# Altium schematic sheet PWM.SchDoc
size A4; SheetNumber: 1; SheetTotal: 4
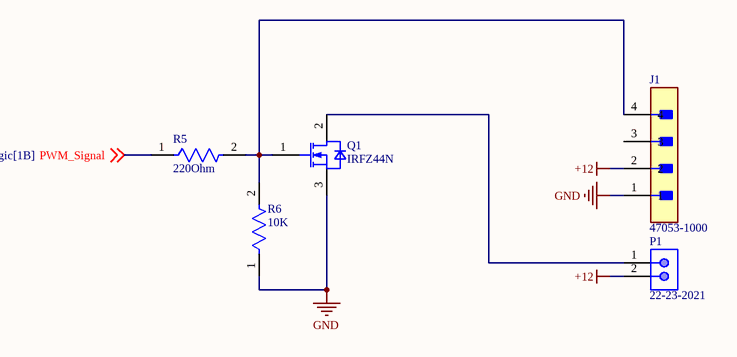
[diagram p0: PWM.SchDoc]

## Parts
J1  47053-1000  [FP-470531000-MFG]
P1  22-23-2021  [MOLX-22-23-2021_V]
Q1  IRFZ44N  [TO220]
R5  220Ohm  [FP-CRGCQ1206-IPC_C]
R6  10K  [FP-CRGCQ1206-IPC_C]

## Nets
+12: J1.2 P1.2
GND: J1.1 Q1.3(SOURCE) R6.1
PWM_Signal: R5.1 ; off-sheet PWM_Signal
NetJ1_4: J1.4 Q1.1(GATE) R5.2 R6.2
NetP1_1: P1.1 Q1.2(DRAIN)

Not connected (* = marked no-connect by the designer): J1 3

## Library data of the parts
J1 = CMP-04776-000290-2: CONN HEADER VERT 4POS 2.54MM; NexarPartId: 854935; Manufacturer Lifecycle Status: ACTIVE; Voltage Rating (DC): 250V; Gender: Male; Plating: Copper; Number of Positions: 4; Glow Wire Compliant: Non-compliant; Current Rating: 500mA; Max Operating Temperature: 75°C; Number of Rows: 1; REACH SVHC: Unknown; Ambient Temperature Range High: 105°C; Pitch: 2.54mm; Height: 7.7mm; Min Operating Temperature: 0°C; Packaging: Bulk; Contact Material: Brass, Copper; Contact Plating: Tin; Lead Pitch: 2.54mm; Voltage Rating: 250V; Termination: Through Hole; Radiation Hardening: No; Orientation: Vertical; Mount: Through Hole; Number of Pins: 4; Country of Origin: HK; Halogen Free: Low Halogen; Lifecycle Status: Production; Number of Circuits: 4; Schedule B: 8536694040, 8536694040; Housing Color: Beige; Housing Material: Nylon; Depth: 5.84mm; RoHS: Compliant; Length: 10.2mm; Number of Contacts: 4
P1 = CMP-1704-00001-3: Male Header, Pitch 2.54 mm, 1 x 2 Position, Height 10.67 mm, Tail Length 3.56 mm, 0 to 75 degC, RoHS, Bulk; Package Quantity: 3000; Height: 10.67 mm; RoHSCompliant: True; ComponentLink2URL: https://datasheet.ciiva.com/19454/232266-19454304.pdf; PartNumber: 22-23-2021; Packaging: Bulk; ComponentLink2Description: Datasheet; Min Operating Temperature: 0 degC; ComponentLink1Description: Manufacturer URL; Length: 5.08 mm; Mounting Technology: Through Hole; Max Operating Temperature: 75 degC; REACH SVHC: Unknown; PackageDescription: Male Header, Pitch 2.54 mm, 1 x 2 Position, Height 10.67 mm, Tail Length 3.56 mm; ComponentLink1URL: http://www.molex.com/; Mount: Through Hole; Radiation Hardening: No; Width: 6.35 mm; Pins: 2
Q1 = IRFZ44N: OptiMOS 3 Power-Transistor, VDS 100V; Manufacturer: Infineon Technologies; Manufacturer Order Number: IRFZ44N; PackageReference: PG-TO220-3-904
R5 R6 = CMP-03211-000249-1: CRGCQ1206 100KΩ 0.25W 1% ±100ppm/°C 200V; Manufacturer: TE Connectivity; Manufacturer Part Number: CRGCQ1206F100K; Tolerance: 0.01; Automotive Grade: Grade 1141; Lead Free: Yes; Power Rating: 0.25W; Resistance: 100KΩ; ComponentLink2Description: Datasheet; Voltage Rating: 200V; Ambient Temperature Range High: +70°C; Device Class L1: Passive Components; Value: 100KΩ; ComponentLink2URL: https://www.te.com/commerce/DocumentDelivery/DDEController?Action=showdoc&DocId=Data+Sheet%7F1773204-3%7F1%7Fpdf%7FEnglish%7FENG_DS_1773204-3_1.pdf%7F4-2176347-1150; Temperature Range High: +155°C; Category: Res; RoHS: TRUE; Temperature: -55°C to +155°C; Series: CRGCQ; Package: CRGCQ1206; Device Class L3: Chip SMD Resistors; Height: 0.65mm; Automotive: Yes; Temperature Coefficient: ±100ppm/°C; Temperature Range Low: -55°C; Ipc Land Pattern Name: RESC310155X55; Device Class L2: Resistors; Octopart: https://octopart.com/crgcq1206f100k-te+connectivity-91018242; Composition: Thick Film